# Altium schematic sheet SiPAP_Schematic.SchDoc
size 330 x 393 mm; SheetNumber: 1; SheetTotal: 2
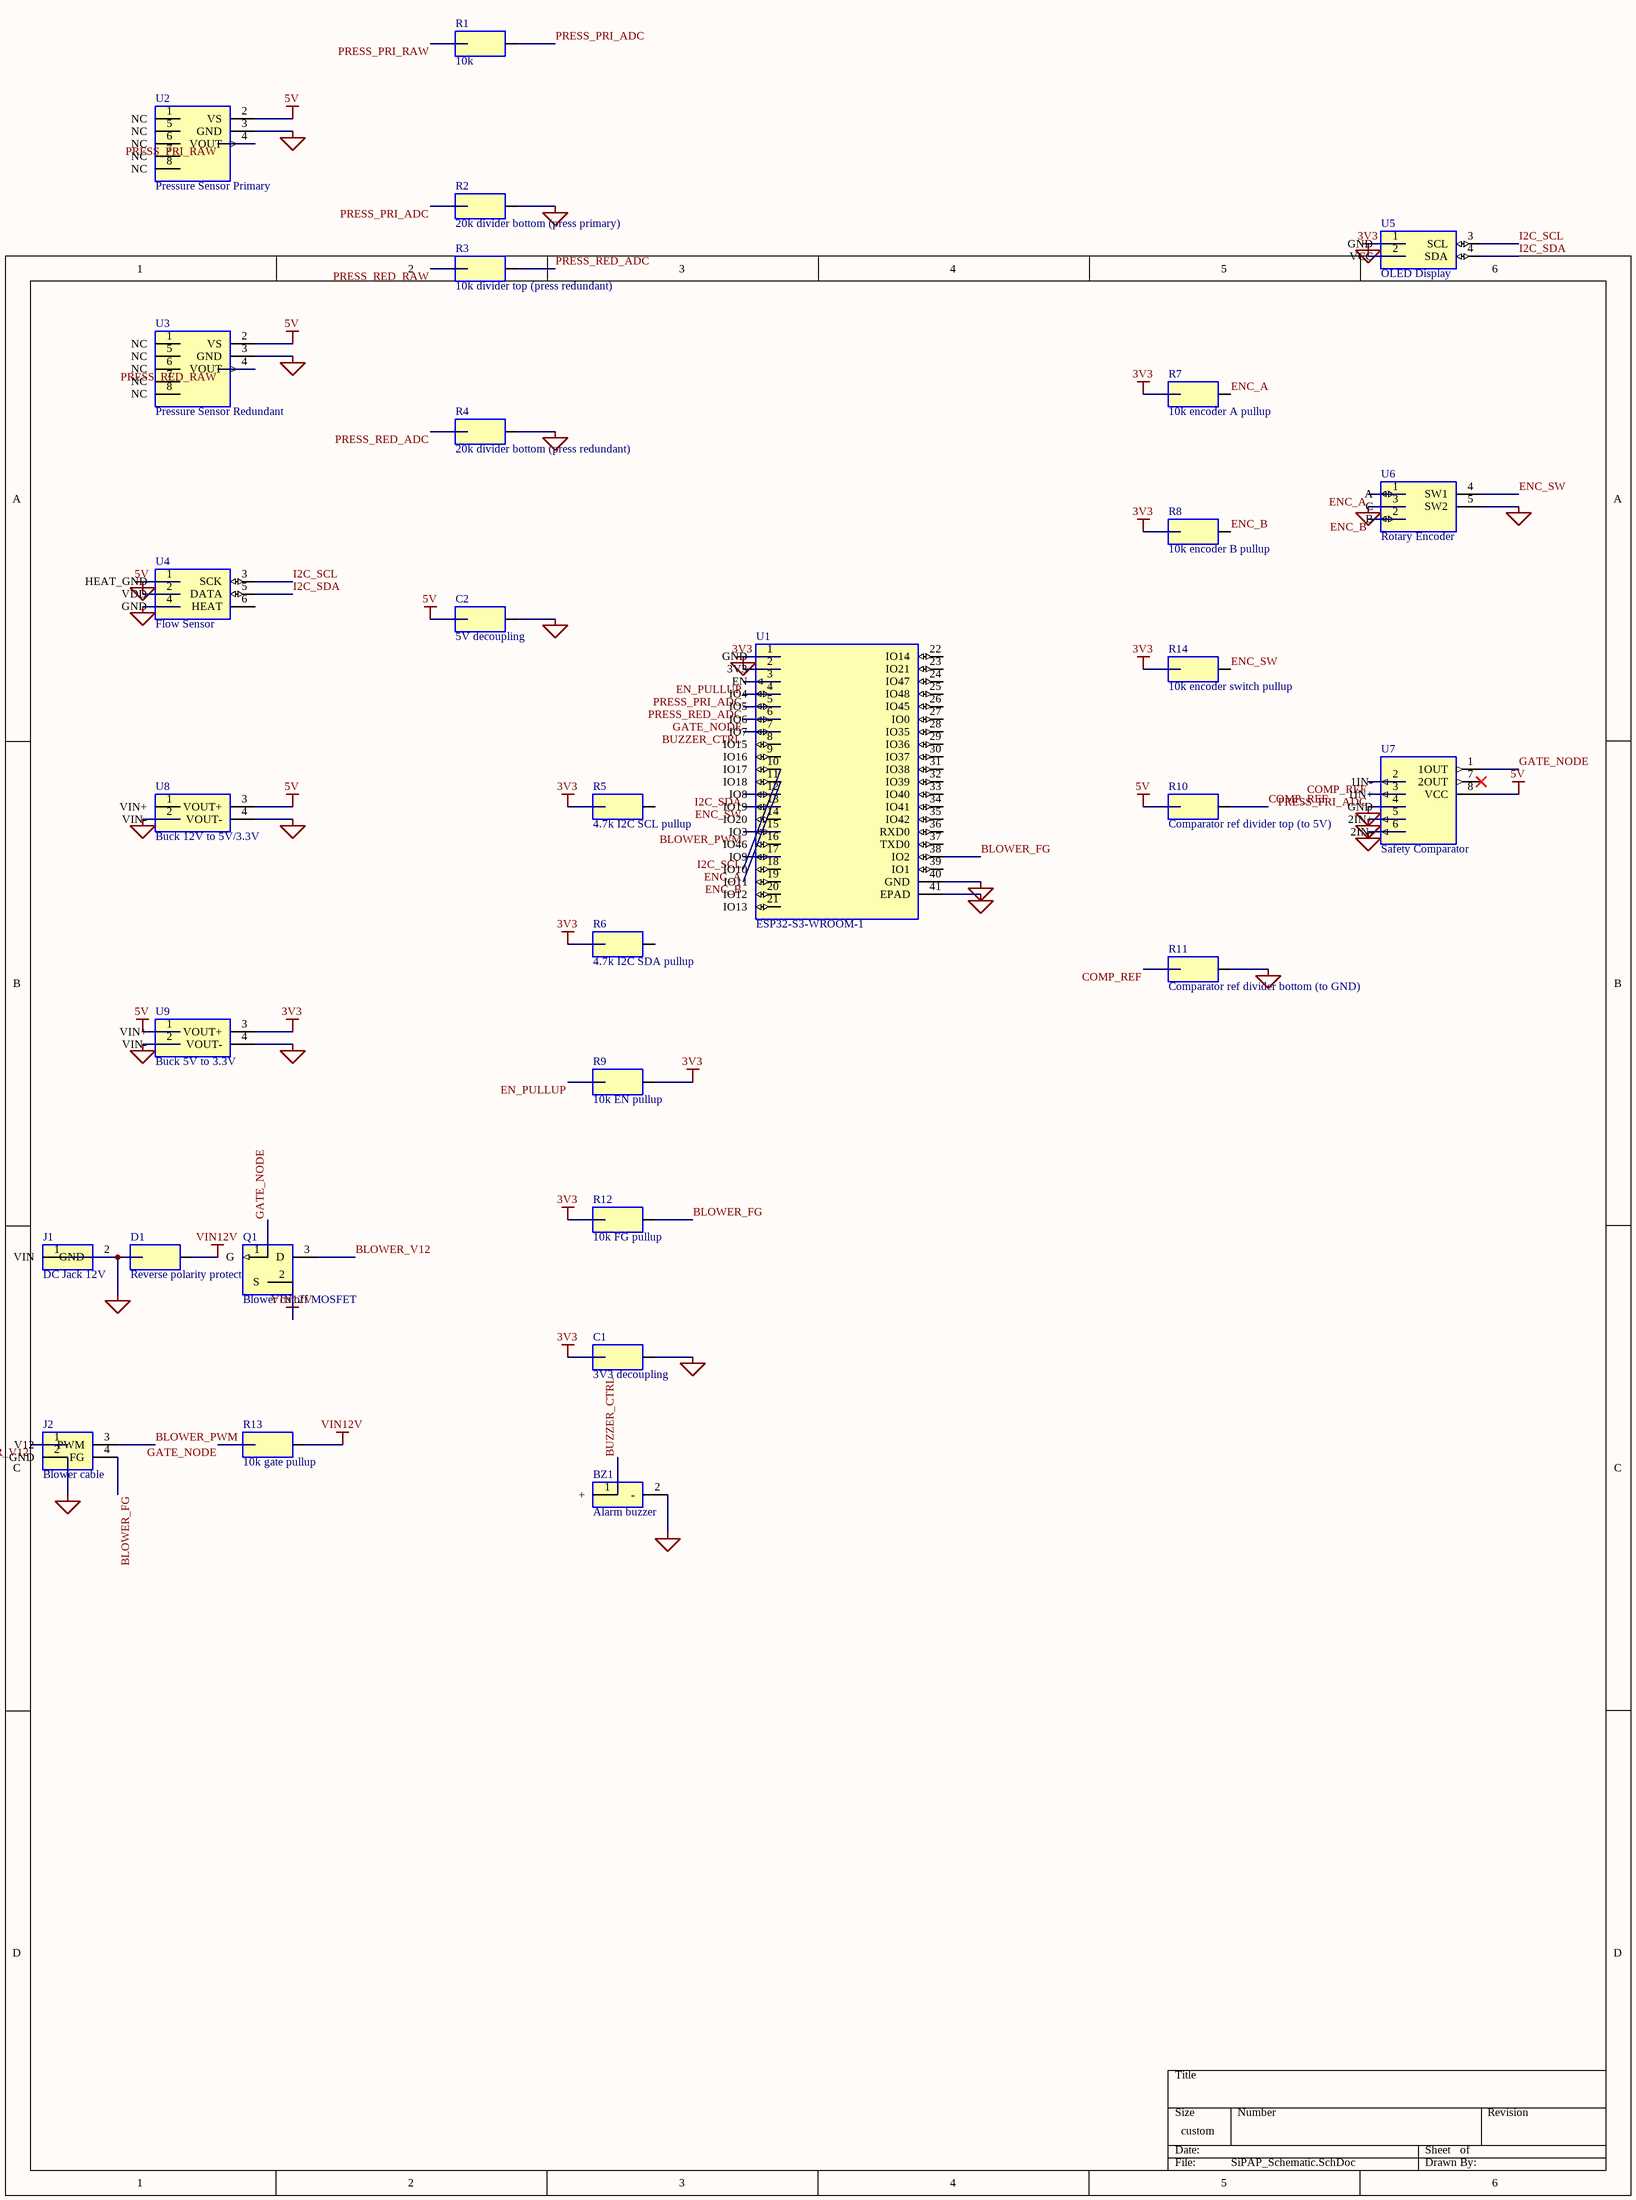
[diagram p0: SiPAP_Schematic.SchDoc]

## Parts
BZ1  Alarm buzzer  [BUZZER_THT_7.6]
C1  3V3 decoupling  [R_0805]
C2  5V decoupling  [R_0805]
D1  Reverse polarity protect  [SOD-123]
J1  DC Jack 12V  [DCJACK_THT_2PIN]
J2  Blower cable  [CONN_HEADER_4_2X2]
Q1  Blower cutoff MOSFET  [SOT-23]
R1  10k  [R_0805]
R2  20k divider bottom (press primary)  [R_0805]
R3  10k divider top (press redundant)  [R_0805]
R4  20k divider bottom (press redundant)  [R_0805]
R5  4.7k I2C SCL pullup  [R_0805]
R6  4.7k I2C SDA pullup  [R_0805]
R7  10k encoder A pullup  [R_0805]
R8  10k encoder B pullup  [R_0805]
R9  10k EN pullup  [R_0805]
R10  Comparator ref divider top (to 5V)  [R_0805]
R11  Comparator ref divider bottom (to GND)  [R_0805]
R12  10k FG pullup  [R_0805]
R13  10k gate pullup  [R_0805]
R14  10k encoder switch pullup  [R_0805]
U1  ESP32-S3-WROOM-1  [ESP32-S3-WROOM-1]
U2  Pressure Sensor Primary  [MPXV5010GC6U]
U3  Pressure Sensor Redundant  [MPXV5010GC6U]
U4  Flow Sensor  [CONN_HEADER_6]
U5  OLED Display  [CONN_HEADER_4]
U6  Rotary Encoder  [PEC11R-4220F-S0024]
U7  Safety Comparator  [SOIC-8]
U8  Buck 12V to 5V/3.3V  [CONN_HEADER_4]
U9  Buck 5V to 3.3V  [CONN_HEADER_4]

## Nets
3V3: C1.1 R5.1 R6.1 R7.1 R8.1 R9.2 R12.1 R14.1 U1.2(3V3) U5.2(VCC) U9.3(VOUT+)
5V: C2.1 R10.1 U2.2(VS) U3.2(VS) U4.2(VDD) U7.8(VCC) U8.3(VOUT+) U9.1(VIN+)
GND: BZ1.2(-) C1.2 C2.2 D1.1(A) J1.1(VIN) J1.2(GND) J2.2(GND) R2.2 R4.2 R11.2 U1.1(GND) U1.40(GND) U1.41(EPAD) U2.3(GND) U3.3(GND) U4.1(HEAT_GND) U4.4(GND) U5.1(GND) U6.3(C) U6.5(SW2) U7.4(GND) U7.5(2IN+) U7.6(2IN-) U8.2(VIN-) U8.4(VOUT-) U9.2(VIN-) U9.4(VOUT-)
VIN12V: D1.2(K) Q1.2(S) R13.2
BLOWER_FG: J2.4(FG) R12.2 U1.38(IO2)
BLOWER_PWM: J2.3(PWM) U1.15(IO3)
BLOWER_V12: J2.1(V12) Q1.3(D)
BUZZER_CTRL: BZ1.1(+) U1.7(IO7)
COMP_REF: R10.2 R11.1 U7.2(1IN-)
EN_PULLUP: R9.1 U1.3(EN)
ENC_A: R7.2 U1.10(IO17) U6.1(A)
ENC_B: R8.2 U1.11(IO18) U6.2(B)
ENC_SW: R14.2 U1.13(IO19) U6.4(SW1)
GATE_NODE: Q1.1(G) R13.1 U1.6(IO6) U7.1(1OUT)
I2C_SCL: U1.17(IO9) U4.3(SCK) U5.3(SCL)
I2C_SDA: U1.12(IO8) U4.5(DATA) U5.4(SDA)
PRESS_PRI_ADC: R1.2 R2.1 U1.4(IO4) U7.3(1IN+)
PRESS_PRI_RAW: R1.1 U2.4(VOUT)
PRESS_RED_ADC: R3.2 R4.1 U1.5(IO5)
PRESS_RED_RAW: R3.1 U3.4(VOUT)

Not connected (* = marked no-connect by the designer): R5 2; R6 2; U1 8(IO15) 9(IO16) 14(IO20) 16(IO46) 18(IO10) 19(IO11) 20(IO12) 21(IO13) 22(IO14) 23(IO21) 24(IO47) 25(IO48) 26(IO45) 27(IO0) 28(IO35) 29(IO36) 30(IO37) 31(IO38) 32(IO39) 33(IO40) 34(IO41) 35(IO42) 36(RXD0) 37(TXD0) 39(IO1); U2 1(NC) 5(NC) 6(NC) 7(NC) 8(NC); U3 1(NC) 5(NC) 6(NC) 7(NC) 8(NC); U4 6(HEAT); U7 7(2OUT)*; U8 1(VIN+)

## Library data of the parts
BZ1 = BUZZER: Generic piezo buzzer, 2-pin
C1 C2 = CAPACITOR: Generic capacitor, 2-pin
D1 = DIODE: Generic diode, 2-pin (A=anode, K=cathode)
J1 = CONN_DCJACK: DC barrel jack 5.5x2.1mm, 2-pin (VIN, GND)
J2 = CONN_BLOWER4: 4-pin blower cable connector: 12V, GND, PWM, FG
Q1 = AO3401A: Alpha&Omega AO3401A P-channel MOSFET, SOT-23 (AOS datasheet)
R1-R14 = RESISTOR: Generic resistor, 2-pin
U1 = ESP32-S3-WROOM-1: Espressif ESP32-S3-WROOM-1 WiFi+BLE module, 41 pins (datasheet v1.8)
U2 U3 = MPXV5010GC6U: NXP/Motorola MPXV5010GC6U pressure sensor, SOP-8 (Case 482A), 0-10kPa analog output
U4 = SFM3300-D: Sensirion SFM3300-D digital flow meter, I2C addr 0x40, 6-pad connector (Datasheet D1 v1.4)
U5 = SSD1306_OLED_I2C: 0.96in 128x64 I2C OLED module, 4-pin (GND,VCC,SCL,SDA), addr 0x3C
U6 = PEC11R-4220F-S0024: Bourns PEC11R rotary encoder w/ push switch, 5 terminals (Bourns datasheet Rev 04/26)
U7 = LM393: Dual comparator, DIP-8/SOIC-8 (TI datasheet SLCS006)
U8 U9 = BUCK_MODULE_12to5: Generic DC-DC buck converter module (e.g. MP1584EN based), 4-pin VIN/VOUT